# Altium schematic sheet 09_Display_Leds-2.SchDoc
size 558 x 431 mm; SheetNumber: 10; SheetTotal: 12
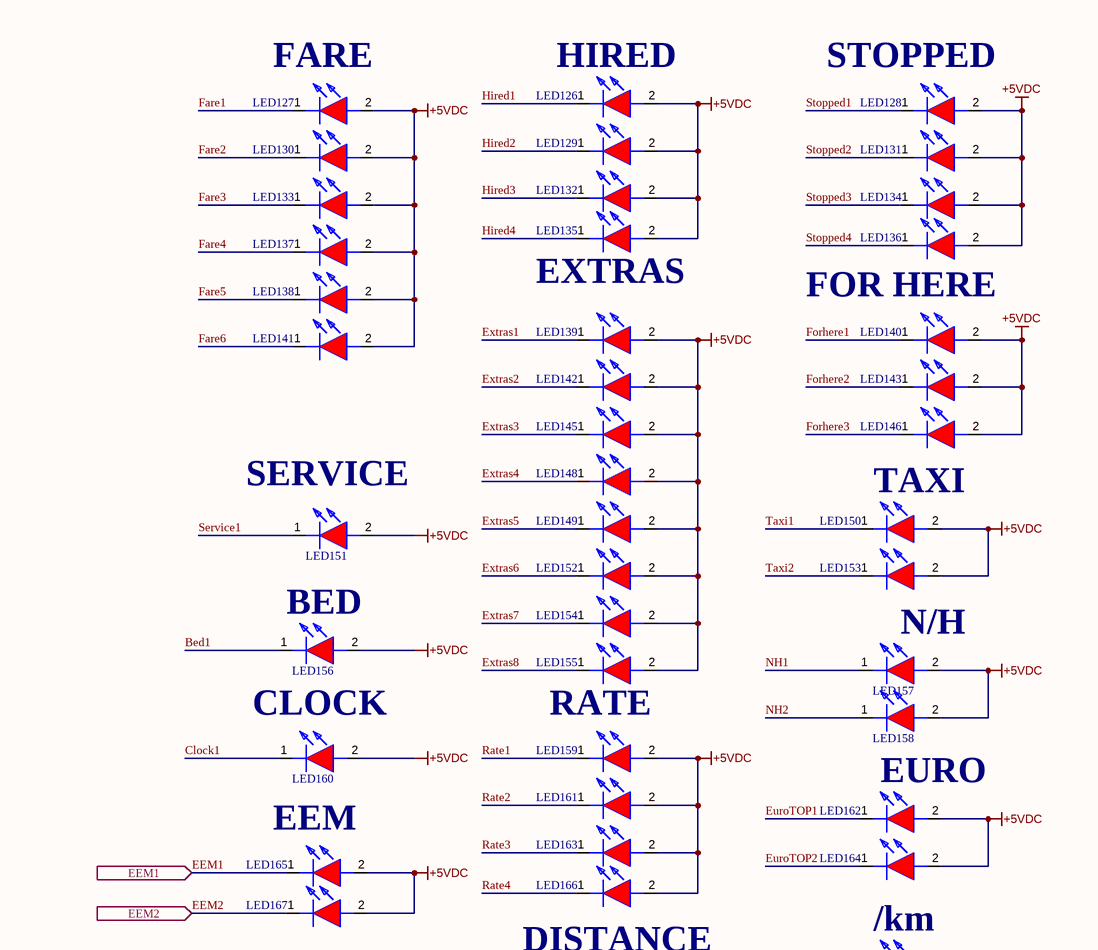
[diagram p0: 09_Display_Leds-2.SchDoc, top right]
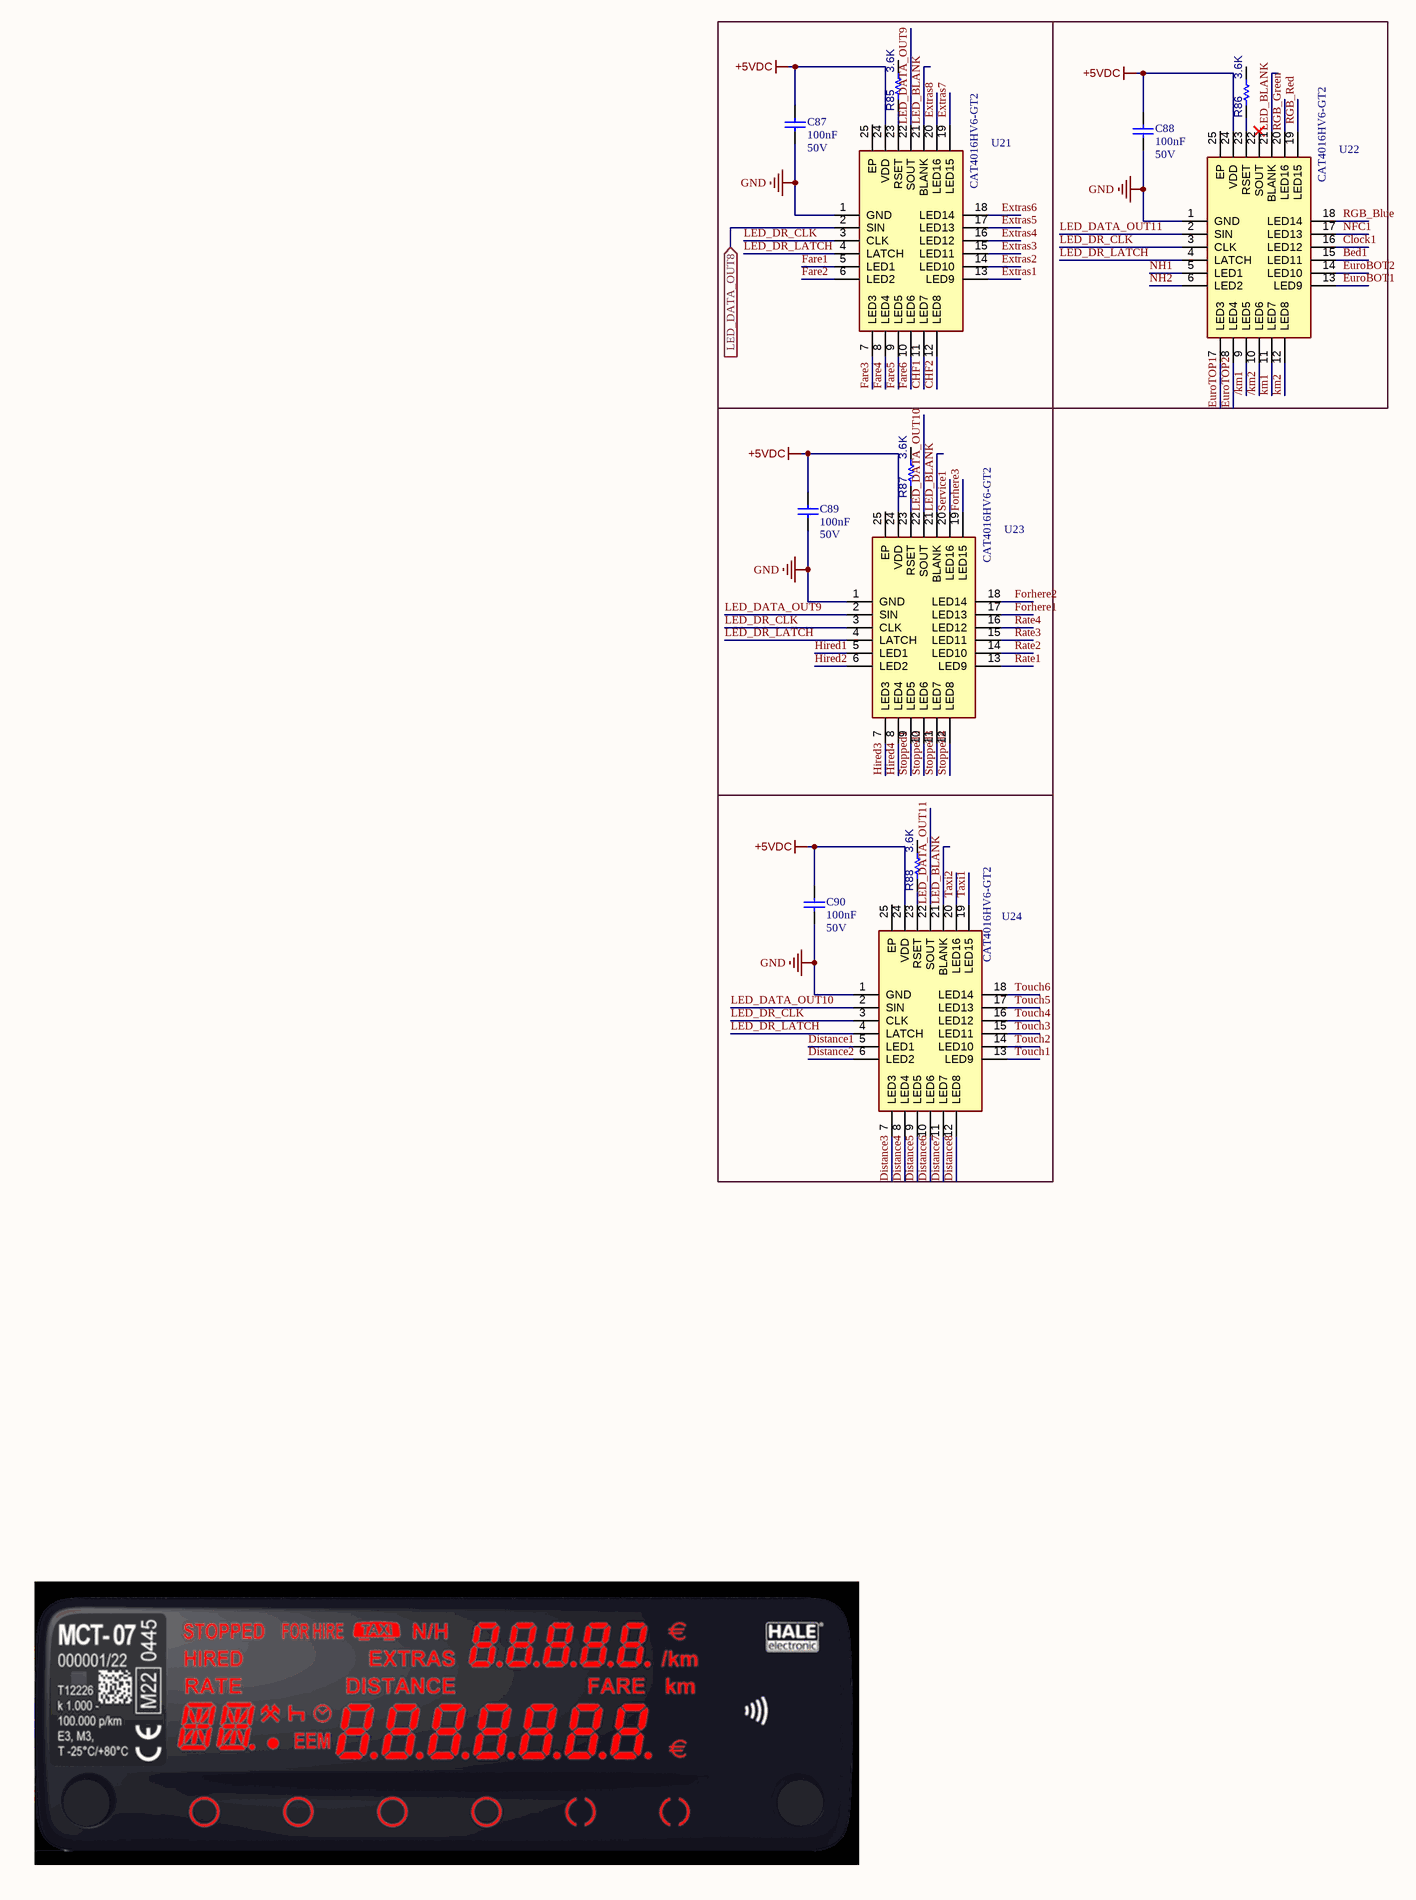
[diagram p1: 09_Display_Leds-2.SchDoc, bottom left]
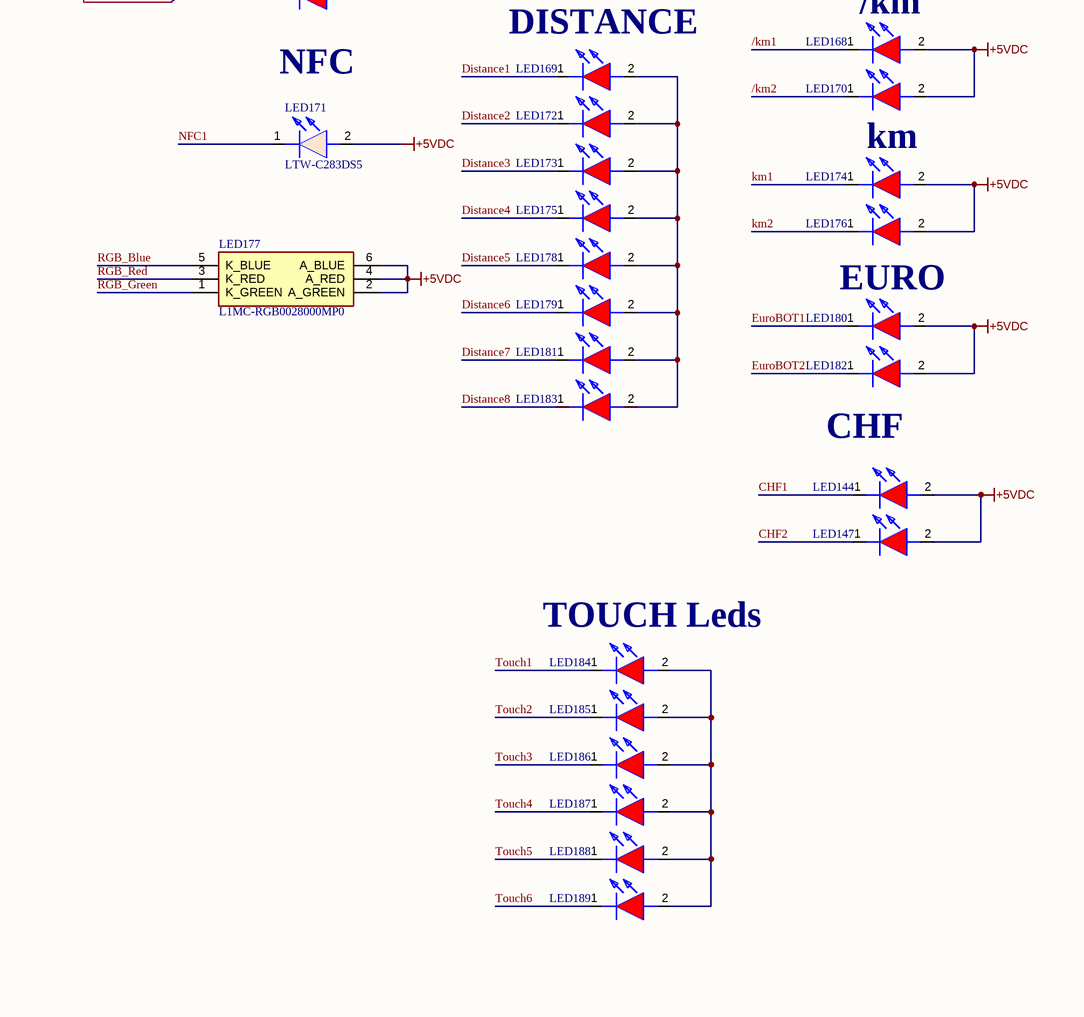
[diagram p2: 09_Display_Leds-2.SchDoc, bottom right]

## Parts
C87  value 100nF  Voltage: 50V  [CAP_0603]  (hidden comment: CAP)
C88  value 100nF  Voltage: 50V  [CAP_0603]  (hidden comment: CAP)
C89  value 100nF  Voltage: 50V  [CAP_0603]  (hidden comment: CAP)
C90  value 100nF  Voltage: 50V  [CAP_0603]  (hidden comment: CAP)
LED126  YLED0402R  [APHHS1005LSECKJ3PF]  (value not drawn)
LED127  YLED0402R  [APHHS1005LSECKJ3PF]  (value not drawn)
LED128  YLED0402R  [APHHS1005LSECKJ3PF]  (value not drawn)
LED129  YLED0402R  [APHHS1005LSECKJ3PF]  (value not drawn)
LED130  YLED0402R  [APHHS1005LSECKJ3PF]  (value not drawn)
LED131  YLED0402R  [APHHS1005LSECKJ3PF]  (value not drawn)
LED132  YLED0402R  [APHHS1005LSECKJ3PF]  (value not drawn)
LED133  YLED0402R  [APHHS1005LSECKJ3PF]  (value not drawn)
LED134  YLED0402R  [APHHS1005LSECKJ3PF]  (value not drawn)
LED135  YLED0402R  [APHHS1005LSECKJ3PF]  (value not drawn)
LED136  YLED0402R  [APHHS1005LSECKJ3PF]  (value not drawn)
LED137  YLED0402R  [APHHS1005LSECKJ3PF]  (value not drawn)
LED138  YLED0402R  [APHHS1005LSECKJ3PF]  (value not drawn)
LED139  YLED0402R  [APHHS1005LSECKJ3PF]  (value not drawn)
LED140  YLED0402R  [APHHS1005LSECKJ3PF]  (value not drawn)
LED141  YLED0402R  [APHHS1005LSECKJ3PF]  (value not drawn)
LED142  YLED0402R  [APHHS1005LSECKJ3PF]  (value not drawn)
LED143  YLED0402R  [APHHS1005LSECKJ3PF]  (value not drawn)
LED144  YLED0402R  [APHHS1005LSECKJ3PF]  (value not drawn)
LED145  YLED0402R  [APHHS1005LSECKJ3PF]  (value not drawn)
LED146  YLED0402R  [APHHS1005LSECKJ3PF]  (value not drawn)
LED147  YLED0402R  [APHHS1005LSECKJ3PF]  (value not drawn)
LED148  YLED0402R  [APHHS1005LSECKJ3PF]  (value not drawn)
LED149  YLED0402R  [APHHS1005LSECKJ3PF]  (value not drawn)
LED150  YLED0402R  [APHHS1005LSECKJ3PF]  (value not drawn)
LED151  YLED0402R  [APHHS1005LSECKJ3PF]  (value not drawn)
LED152  YLED0402R  [APHHS1005LSECKJ3PF]  (value not drawn)
LED153  YLED0402R  [APHHS1005LSECKJ3PF]  (value not drawn)
LED154  YLED0402R  [APHHS1005LSECKJ3PF]  (value not drawn)
LED155  YLED0402R  [APHHS1005LSECKJ3PF]  (value not drawn)
LED156  YLED0402R  [APHHS1005LSECKJ3PF]  (value not drawn)
LED157  YLED0402R  [APHHS1005LSECKJ3PF]  (value not drawn)
LED158  YLED0402R  [APHHS1005LSECKJ3PF]  (value not drawn)
LED159  YLED0402R  [APHHS1005LSECKJ3PF]  (value not drawn)
LED160  YLED0402R  [APHHS1005LSECKJ3PF]  (value not drawn)
LED161  YLED0402R  [APHHS1005LSECKJ3PF]  (value not drawn)
LED162  YLED0402R  [APHHS1005LSECKJ3PF]  (value not drawn)
LED163  YLED0402R  [APHHS1005LSECKJ3PF]  (value not drawn)
LED164  YLED0402R  [APHHS1005LSECKJ3PF]  (value not drawn)
LED165  YLED0402R  [APHHS1005LSECKJ3PF]  (value not drawn)
LED166  YLED0402R  [APHHS1005LSECKJ3PF]  (value not drawn)
LED167  YLED0402R  [APHHS1005LSECKJ3PF]  (value not drawn)
LED168  YLED0402R  [APHHS1005LSECKJ3PF]  (value not drawn)
LED169  YLED0402R  [APHHS1005LSECKJ3PF]  (value not drawn)
LED170  YLED0402R  [APHHS1005LSECKJ3PF]  (value not drawn)
LED171  LTW-C283DS5  [APHHS1005LSECKJ3PF]
LED172  YLED0402R  [APHHS1005LSECKJ3PF]  (value not drawn)
LED173  YLED0402R  [APHHS1005LSECKJ3PF]  (value not drawn)
LED174  YLED0402R  [APHHS1005LSECKJ3PF]  (value not drawn)
LED175  YLED0402R  [APHHS1005LSECKJ3PF]  (value not drawn)
LED176  YLED0402R  [APHHS1005LSECKJ3PF]  (value not drawn)
LED177  L1MC-RGB0028000MP0  [L1MCRGB0028000MP0]
LED178  YLED0402R  [APHHS1005LSECKJ3PF]  (value not drawn)
LED179  YLED0402R  [APHHS1005LSECKJ3PF]  (value not drawn)
LED180  YLED0402R  [APHHS1005LSECKJ3PF]  (value not drawn)
LED181  YLED0402R  [APHHS1005LSECKJ3PF]  (value not drawn)
LED182  YLED0402R  [APHHS1005LSECKJ3PF]  (value not drawn)
LED183  YLED0402R  [APHHS1005LSECKJ3PF]  (value not drawn)
LED184  YLED0402R  [APHHS1005LSECKJ3PF]  (value not drawn)
LED185  YLED0402R  [APHHS1005LSECKJ3PF]  (value not drawn)
LED186  YLED0402R  [APHHS1005LSECKJ3PF]  (value not drawn)
LED187  YLED0402R  [APHHS1005LSECKJ3PF]  (value not drawn)
LED188  YLED0402R  [APHHS1005LSECKJ3PF]  (value not drawn)
LED189  YLED0402R  [APHHS1005LSECKJ3PF]  (value not drawn)
R85  value 3.6K  [RES_0603]  (hidden comment: RC0603FR-133K6L)
R86  value 3.6K  [RES_0603]  (hidden comment: RC0603FR-133K6L)
R87  value 3.6K  [RES_0603]  (hidden comment: RC0603FR-133K6L)
R88  value 3.6K  [RES_0603]  (hidden comment: RC0603FR-133K6L)
U21  CAT4016HV6-GT2  [QFN50P400X400X80-25N-D]
U22  CAT4016HV6-GT2  [QFN50P400X400X80-25N-D]
U23  CAT4016HV6-GT2  [QFN50P400X400X80-25N-D]
U24  CAT4016HV6-GT2  [QFN50P400X400X80-25N-D]

## Ports
EEM1 (in), EEM2 (in), LED_DATA_OUT8 (in)

## Nets
+5VDC: C87.1 C88.1 C89.1 C90.1 LED126.2(A) LED127.2(A) LED128.2(A) LED129.2(A) LED130.2(A) LED131.2(A) LED132.2(A) LED133.2(A) LED134.2(A) LED135.2(A) LED136.2(A) LED137.2(A) LED138.2(A) LED139.2(A) LED140.2(A) LED141.2(A) LED142.2(A) LED143.2(A) LED144.2(A) LED145.2(A) LED146.2(A) LED147.2(A) LED148.2(A) LED149.2(A) LED150.2(A) LED151.2(A) LED152.2(A) LED153.2(A) LED154.2(A) LED155.2(A) LED156.2(A) LED157.2(A) LED158.2(A) LED159.2(A) LED160.2(A) LED161.2(A) LED162.2(A) LED163.2(A) LED164.2(A) LED165.2(A) LED166.2(A) LED167.2(A) LED168.2(A) LED170.2(A) LED171.2(A) LED174.2(A) LED176.2(A) LED177.2(A_GREEN) LED177.4(A_RED) LED177.6(A_BLUE) LED180.2(A) LED182.2(A) U21.24(VDD) U22.24(VDD) U23.24(VDD) U24.24(VDD)
GND: C87.2 C88.2 C89.2 C90.2 U21.1(GND) U22.1(GND) U23.1(GND) U24.1(GND)
/km1: LED168.1(K) U22.9(LED5)
/km2: LED170.1(K) U22.10(LED6)
Bed1: LED156.1(K) U22.15(LED11)
CHF1: LED144.1(K) U21.11(LED7)
CHF2: LED147.1(K) U21.12(LED8)
Clock1: LED160.1(K) U22.16(LED12)
Distance1: LED169.1(K) U24.5(LED1)
Distance2: LED172.1(K) U24.6(LED2)
Distance3: LED173.1(K) U24.7(LED3)
Distance4: LED175.1(K) U24.8(LED4)
Distance5: LED178.1(K) U24.9(LED5)
Distance6: LED179.1(K) U24.10(LED6)
Distance7: LED181.1(K) U24.11(LED7)
Distance8: LED183.1(K) U24.12(LED8)
EEM1: LED165.1(K) ; port EEM1
EEM2: LED167.1(K) ; port EEM2
EuroBOT1: LED180.1(K) U22.13(LED9)
EuroBOT2: LED182.1(K) U22.14(LED10)
EuroTOP1: LED162.1(K) U22.7(LED3)
EuroTOP2: LED164.1(K) U22.8(LED4)
Extras1: LED139.1(K) U21.13(LED9)
Extras2: LED142.1(K) U21.14(LED10)
Extras3: LED145.1(K) U21.15(LED11)
Extras4: LED148.1(K) U21.16(LED12)
Extras5: LED149.1(K) U21.17(LED13)
Extras6: LED152.1(K) U21.18(LED14)
Extras7: LED154.1(K) U21.19(LED15)
Extras8: LED155.1(K) U21.20(LED16)
Fare1: LED127.1(K) U21.5(LED1)
Fare2: LED130.1(K) U21.6(LED2)
Fare3: LED133.1(K) U21.7(LED3)
Fare4: LED137.1(K) U21.8(LED4)
Fare5: LED138.1(K) U21.9(LED5)
Fare6: LED141.1(K) U21.10(LED6)
Forhere1: LED140.1(K) U23.17(LED13)
Forhere2: LED143.1(K) U23.18(LED14)
Forhere3: LED146.1(K) U23.19(LED15)
Hired1: LED126.1(K) U23.5(LED1)
Hired2: LED129.1(K) U23.6(LED2)
Hired3: LED132.1(K) U23.7(LED3)
Hired4: LED135.1(K) U23.8(LED4)
km1: LED174.1(K) U22.11(LED7)
km2: LED176.1(K) U22.12(LED8)
LED_BLANK: U21.21(BLANK) U22.21(BLANK) U23.21(BLANK) U24.21(BLANK)
LED_DATA_OUT8: U21.2(SIN) ; port LED_DATA_OUT8
LED_DATA_OUT9: U21.22(SOUT) U23.2(SIN)
LED_DATA_OUT10: U23.22(SOUT) U24.2(SIN)
LED_DATA_OUT11: U22.2(SIN) U24.22(SOUT)
LED_DR_CLK: U21.3(CLK) U22.3(CLK) U23.3(CLK) U24.3(CLK)
LED_DR_LATCH: U21.4(LATCH) U22.4(LATCH) U23.4(LATCH) U24.4(LATCH)
NFC1: LED171.1(K) U22.17(LED13)
NH1: LED157.1(K) U22.5(LED1)
NH2: LED158.1(K) U22.6(LED2)
Rate1: LED159.1(K) U23.13(LED9)
Rate2: LED161.1(K) U23.14(LED10)
Rate3: LED163.1(K) U23.15(LED11)
Rate4: LED166.1(K) U23.16(LED12)
RGB_Blue: LED177.5(K_BLUE) U22.18(LED14)
RGB_Green: LED177.1(K_GREEN) U22.20(LED16)
RGB_Red: LED177.3(K_RED) U22.19(LED15)
Service1: LED151.1(K) U23.20(LED16)
Stopped1: LED128.1(K) U23.9(LED5)
Stopped2: LED131.1(K) U23.10(LED6)
Stopped3: LED134.1(K) U23.11(LED7)
Stopped4: LED136.1(K) U23.12(LED8)
Taxi1: LED150.1(K) U24.19(LED15)
Taxi2: LED153.1(K) U24.20(LED16)
Touch1: LED184.1(K) U24.13(LED9)
Touch2: LED185.1(K) U24.14(LED10)
Touch3: LED186.1(K) U24.15(LED11)
Touch4: LED187.1(K) U24.16(LED12)
Touch5: LED188.1(K) U24.17(LED13)
Touch6: LED189.1(K) U24.18(LED14)
NetLED169_2: LED169.2(A) LED172.2(A) LED173.2(A) LED175.2(A) LED178.2(A) LED179.2(A) LED181.2(A) LED183.2(A)
NetLED184_2: LED184.2(A) LED185.2(A) LED186.2(A) LED187.2(A) LED188.2(A) LED189.2(A)
NetR85_1: R85.1 U21.23(RSET)
NetR86_1: R86.1 U22.23(RSET)
NetR87_1: R87.1 U23.23(RSET)
NetR88_1: R88.1 U24.23(RSET)

Not connected (* = marked no-connect by the designer): R85 2; R86 2; R87 2; R88 2; U21 25(EP); U22 22(SOUT)* 25(EP); U23 25(EP); U24 25(EP)

## Notes on the sheet
- (near LED127) FARE
- (near LED126) HIRED
- (near LED128) STOPPED
- (near LED135) EXTRAS
- FOR HERE
- (near LED151) SERVICE
- TAXI
- (near LED156) BED
- N/H
- CLOCK
- (near LED155) RATE
- EURO
- EEM
- NFC
- DISTANCE
- /km
- km
- CHF
- (near LED184) TOUCH Leds
- DWG. NO.
- REV.
- SHT.
- REVISION
- DESCRIPTION
- DATE
- APPROVED
- THIS DOCUMENT AND THE DATA DISCLOSED HEREIN OR HEREWITH IS THE PROPERTY OF ALTIUM LIMITED AND MAY BE FREELY DISTRIBUTED IN WHOLE. NO RIGHTS ARE RESERVED OR EXPRESS OR IMPLIED WARANTEE GIVEN.
- ENG:
- DSN:
- APPROVALS
- PROJECT
- DOCUMENT REVISION:
- DESIGN ITEM:
- CHK:
- BOM:
- REFERENCE DOCUMENTS
- PROJECT REVISION:
- TITLE
- FAB DWG:
- PCB DWG:
- ASSY DWG:
- SCALE:
- SIZE
- C
- CAGE CODE
- FILE NAME
- DWG NO.
- SHEET
- OF
- REV

## Library data of the parts
C87-C90 = C01763: CAP CER 100nF 50VDC %10 X7R SMD; Manufacturer: Samsung; Manufacturer Part Number: CL10B104KB8NNNL
LED126-LED170 LED172-LED176 LED178-LED189 = YLED0402R: LED RED WATER CLEAR 0402 SMD; Manufacturer: Kingbright; Value: 0402; Manufacturer Part Number: YLED0402R
LED171 = LTW-C283DS5: LED WHITE YELLOW LENS 0402 SMD; Manufacturer: LITEON; Value: 0402; Manufacturer Part Number: LTW-C283DS5
LED177 = L1MC-RGB0028000MP0: LED; Manufacturer_Name: Lumileds; Datasheet Link: https://lumileds.com/wp-content/uploads/2022/03/DS388-luxeon-3528-rgb-datasheet.pdf; Height: 1.85mm; Manufacturer_Part_Number: L1MC-RGB0028000MP0; Mouser Part Number: 997-L1MCRGB00280MP; Mouser Price/Stock: https://www.mouser.co.uk/ProductDetail/Lumileds/L1MC-RGB0028000MP0?qs=Znm5pLBrcAJSGF05jr80lQ%3D%3D; Arrow Part Number: L1MC-RGB0028000MP0; Arrow Price/Stock: https://www.arrow.com/en/products/l1mc-rgb0028000mp0/lumileds.html?utm_currency=USD&region=nac
R85-R88 = 0603SAF3301T5E: RES.(1608) 0603 3.6K Ohms 1% 1/10W 100PPM SMT; Manufacturer: YAGEO; Manufacturer Part Number: RC0603FR-133K6L
U21-U24 = CAT4016HV6-GT2: Integrated Circuit; Manufacturer_Name: onsemi; Datasheet Link: https://www.onsemi.com/download/data-sheet/pdf/cat4016-d.pdf; Height: 0.8mm; Manufacturer_Part_Number: CAT4016HV6-GT2; Mouser Part Number: 698-CAT4016HV6-GT2; Mouser Price/Stock: https://www.mouser.co.uk/ProductDetail/onsemi/CAT4016HV6-GT2?qs=rZgeL6XvLwaPp0eUTTX%2FiA%3D%3D; Arrow Part Number: CAT4016HV6-GT2; Arrow Price/Stock: https://www.arrow.com/en/products/cat4016hv6-gt2/on-semiconductor